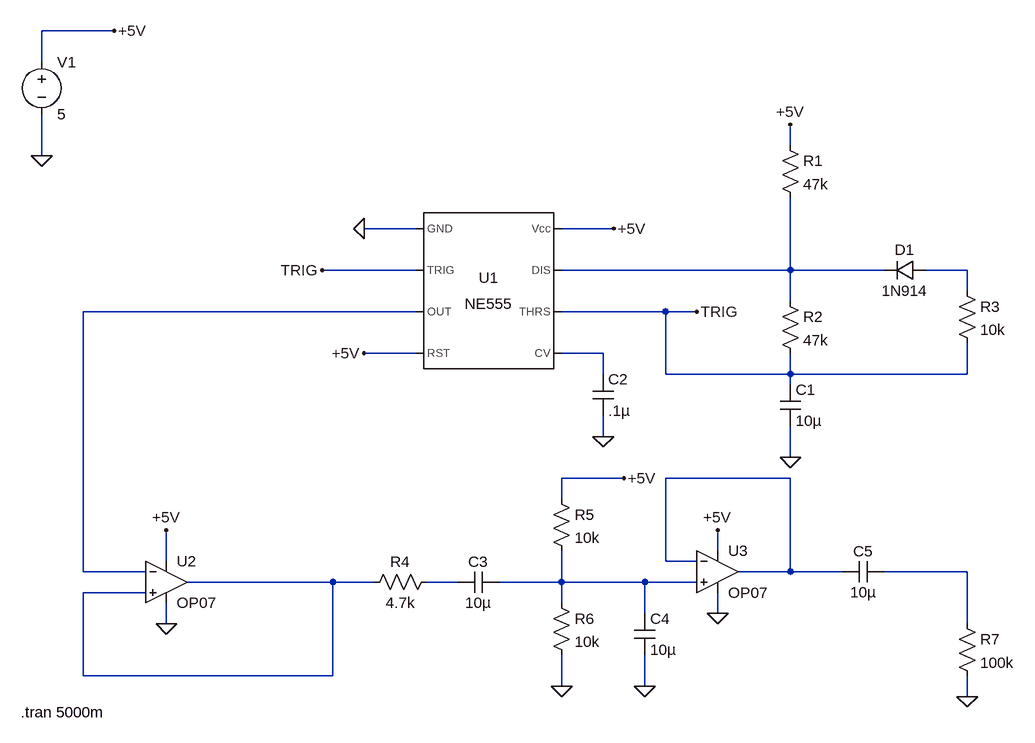
[diagram p0: schematic ecg_generator.asc]
ecg_generator.asc, the LTspice schematic file:
Version 4.1
SHEET 1 1008 824
WIRE -384 -240 -496 -240
WIRE -496 -192 -496 -240
WIRE 656 -64 656 -96
WIRE -496 -48 -496 -112
WIRE 80 64 0 64
WIRE 384 64 304 64
WIRE 80 128 -64 128
WIRE 656 128 656 16
WIRE 656 128 304 128
WIRE 800 128 656 128
WIRE 928 128 864 128
WIRE 928 160 928 128
WIRE 656 176 656 128
WIRE 80 192 -432 192
WIRE 464 192 304 192
WIRE 512 192 464 192
WIRE 80 256 0 256
WIRE 368 256 304 256
WIRE 368 288 368 256
WIRE 464 288 464 192
WIRE 656 288 656 256
WIRE 656 288 464 288
WIRE 928 288 928 240
WIRE 928 288 656 288
WIRE 656 304 656 288
WIRE 368 384 368 352
WIRE 656 416 656 368
WIRE 400 448 304 448
WIRE 656 448 464 448
WIRE 304 480 304 448
WIRE 544 560 544 528
WIRE -304 576 -304 528
WIRE 464 576 464 448
WIRE 512 576 464 576
WIRE -432 592 -432 192
WIRE -336 592 -432 592
WIRE 656 592 656 448
WIRE 656 592 576 592
WIRE 736 592 656 592
WIRE 928 592 800 592
WIRE -48 608 -272 608
WIRE 16 608 -48 608
WIRE 144 608 96 608
WIRE 304 608 304 560
WIRE 304 608 208 608
WIRE 432 608 304 608
WIRE 512 608 432 608
WIRE -336 624 -432 624
WIRE 304 640 304 608
WIRE 432 656 432 608
WIRE 544 656 544 624
WIRE -304 672 -304 640
WIRE 928 672 928 592
WIRE -432 752 -432 624
WIRE -48 752 -48 608
WIRE -48 752 -432 752
WIRE 304 768 304 720
WIRE 432 768 432 720
WIRE 928 784 928 752
FLAG 0 64 0
FLAG -64 128 TRIG
FLAG -496 -48 0
FLAG -384 -240 +5V
FLAG 384 64 +5V
FLAG 656 -96 +5V
FLAG 656 416 0
FLAG 0 256 +5V
FLAG 368 384 0
FLAG 512 192 TRIG
FLAG 304 768 0
FLAG 432 768 0
FLAG 928 784 0
FLAG 400 448 +5V
FLAG -304 672 0
FLAG 544 656 0
FLAG -304 528 +5V
FLAG 544 528 +5V
SYMBOL Misc\\NE555 192 160 R0
SYMATTR InstName U1
SYMBOL voltage -496 -208 R0
SYMATTR InstName V1
SYMATTR Value 5
SYMBOL diode 864 112 R90
WINDOW 0 0 32 VBottom 2
WINDOW 3 32 32 VTop 2
SYMATTR InstName D1
SYMATTR Value 1N914
SYMBOL res 640 -80 R0
SYMATTR InstName R1
SYMATTR Value 47k
SYMBOL res 640 160 R0
SYMATTR InstName R2
SYMATTR Value 47k
SYMBOL cap 640 304 R0
SYMATTR InstName C1
SYMATTR Value 10µ
SYMBOL cap 352 288 R0
SYMATTR InstName C2
SYMATTR Value .1µ
SYMBOL res 912 144 R0
SYMATTR InstName R3
SYMATTR Value 10k
SYMBOL res 112 592 R90
WINDOW 0 0 56 VBottom 2
WINDOW 3 32 56 VTop 2
SYMATTR InstName R4
SYMATTR Value 4.7k
SYMBOL cap 208 592 R90
WINDOW 0 0 32 VBottom 2
WINDOW 3 32 32 VTop 2
SYMATTR InstName C3
SYMATTR Value 10µ
SYMBOL res 288 464 R0
SYMATTR InstName R5
SYMATTR Value 10k
SYMBOL res 288 624 R0
SYMATTR InstName R6
SYMATTR Value 10k
SYMBOL cap 416 656 R0
SYMATTR InstName C4
SYMATTR Value 10µ
SYMBOL cap 800 576 R90
WINDOW 0 0 32 VBottom 2
WINDOW 3 32 32 VTop 2
SYMATTR InstName C5
SYMATTR Value 10µ
SYMBOL res 912 656 R0
SYMATTR InstName R7
SYMATTR Value 100k
SYMBOL OpAmps\\OP07 -304 544 R0
SYMATTR InstName U2
SYMBOL OpAmps\\OP07 544 528 R0
SYMATTR InstName U3
TEXT -528 808 Left 2 !.tran 5000m

The netlist it stands for:
* ecg_generator.asc
X§U1 0 TRIG N003 +5V N004 TRIG N001 +5V NE555  ; pins GND TRIG OUT RST CV THRS DIS Vcc
V1 +5V 0 5
D1 N002 N001 1N914
R1 +5V N001 47k
R2 N001 TRIG 47k
C1 TRIG 0 10µ
C2 N004 0 .1µ
R3 N002 TRIG 10k
R4 N008 N007 4.7k
C3 N009 N008 10µ
R5 +5V N009 10k
R6 N009 0 10k
C4 N009 0 10µ
C5 N006 N005 10µ
R7 N006 0 100k
X§U2 N007 N003 +5V 0 N007 LT1001  ; OP07, pins In+ In- V+ V- OUT
X§U3 N009 N005 +5V 0 N005 LT1001  ; OP07, pins In+ In- V+ V- OUT
.model D D
.lib standard.dio
.tran 5000m
.lib NE555.sub
.lib LTC.lib
.backanno
.end